# Altium schematic sheet TemperatureSensors.SchDoc: Temperaturas e termopares
size 420 x 297 mm; Author: Matheus Markies; DrawnBy: Matheus Markies; Engineer: Matheus Markies; DocumentNumber: ECTU-SCH-12; Revision: A definir; SheetNumber: 12; SheetTotal: 12; ProjectTitle: ROUTE ECU / ECTU; DocumentStatus: Em desenvolvimento; DocumentDate: 14/10/2026
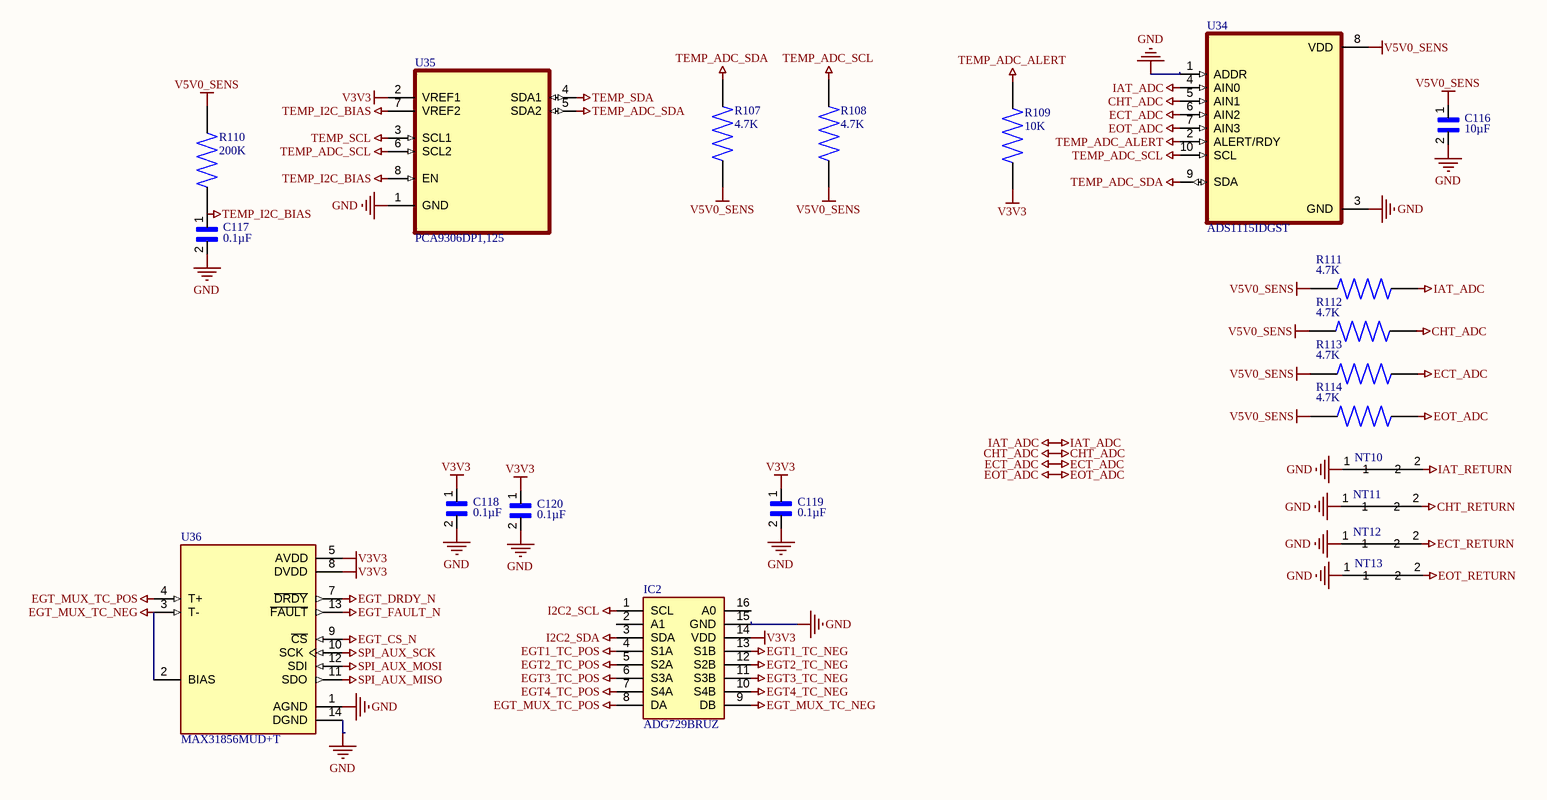
[diagram p0: TemperatureSensors.SchDoc]

## Parts
C116  10µF  [CAPC1608X90N]
C117  0.1µF  [CAPC1608X90N]
C118  0.1µF  [CAPC1608X90N]
C119  0.1µF  [CAPC1608X90N]
C120  0.1µF  [CAPC1608X90N]
IC2  ADG729BRUZ  [SOP65P640X120-16N]
NT10  (no value)  [NetTie]  (net tie, no BOM)
NT11  (no value)  [NetTie]  (net tie, no BOM)
NT12  (no value)  [NetTie]  (net tie, no BOM)
NT13  (no value)  [NetTie]  (net tie, no BOM)
R107  4.7K  [RESC3116X65N]
R108  4.7K  [RESC3116X65N]
R109  10K  [RESC3116X65N]
R110  200K  [RESC3116X65N]
R111  4.7K  [RESC3116X65N]
R112  4.7K  [RESC3116X65N]
R113  4.7K  [RESC3116X65N]
R114  4.7K  [RESC3116X65N]
U34  ADS1115IDGST  [SOP50P490X110-10N]
U35  PCA9306DP1,125  [SOP65P400X110-8N]
U36  MAX31856MUD+T  [SOP65P640X110-14N]

## Nets
CHT_ADC: R112.1 U34.5(AIN1)
CHT_RETURN: NT11.2
ECT_ADC: R113.1 U34.6(AIN2)
ECT_RETURN: NT12.2
EGT1_TC_NEG: IC2.13(S1B)
EGT1_TC_POS: IC2.4(S1A)
EGT2_TC_NEG: IC2.12(S2B)
EGT2_TC_POS: IC2.5(S2A)
EGT3_TC_NEG: IC2.11(S3B)
EGT3_TC_POS: IC2.6(S3A)
EGT4_TC_NEG: IC2.10(S4B)
EGT4_TC_POS: IC2.7(S4A)
EGT_CS_N: U36.9(~{CS})
EGT_DRDY_N: U36.7(~{DRDY})
EGT_FAULT_N: U36.13(~{FAULT})
EGT_MUX_TC_NEG: IC2.9(DB) U36.2(BIAS) U36.3(T-)
EGT_MUX_TC_POS: IC2.8(DA) U36.4(T+)
EOT_ADC: R114.1 U34.7(AIN3)
EOT_RETURN: NT13.2
GND: C116.2 C117.2 C118.2 C119.2 C120.2 IC2.15(GND) NT10.1 NT11.1 NT12.1 NT13.1 U34.1(ADDR) U34.3(GND) U35.1(GND) U36.1(AGND) U36.14(DGND)
I2C2_SCL: IC2.1(SCL)
I2C2_SDA: IC2.3(SDA)
IAT_ADC: R111.1 U34.4(AIN0)
IAT_RETURN: NT10.2
SPI_AUX_MISO: U36.11(SDO)
SPI_AUX_MOSI: U36.12(SDI)
SPI_AUX_SCK: U36.10(SCK)
TEMP_ADC_ALERT: R109.1 U34.2(ALERT/RDY)
TEMP_ADC_SCL: R108.1 U34.10(SCL) U35.6(SCL2)
TEMP_ADC_SDA: R107.1 U34.9(SDA) U35.5(SDA2)
TEMP_I2C_BIAS: C117.1 R110.2 U35.7(VREF2) U35.8(EN)
TEMP_SCL: U35.3(SCL1)
TEMP_SDA: U35.4(SDA1)
V3V3: C118.1 C119.1 C120.1 IC2.14(VDD) R109.2 U35.2(VREF1) U36.5(AVDD) U36.8(DVDD)
V5V0_SENS: C116.1 R107.2 R108.2 R110.1 R111.2 R112.2 R113.2 R114.2 U34.8(VDD)

Not connected (* = marked no-connect by the designer): IC2 2(A1) 16(A0)

## Notes on the sheet
- PROJETO
- STATUS
- FOLHA / SUBSISTEMA
- AUTOR
- CÓDIGO DO DESENHO
- ARQUIVO
- ATUALIZAÇÃO
- REVISÃO
- FOLHA
- FORMATO
- A3
- /

## Library data of the parts
C116-C120 = 06035C104MAZ2A: Multilayer Ceramic Capacitors MLCC - SMD/SMT; Package: None; Price: None; Value: *; MP: 06035C104MAZ2A; Availability: Unavailable
IC2 = ADG729BRUZ: Integrated Circuit; Manufacturer_Name: Analog Devices; Datasheet Link: https://componentsearchengine.com/Datasheets/2/ADG729BRUZ.pdf; Height: 1.2mm; Manufacturer_Part_Number: ADG729BRUZ; Mouser Part Number: 584-ADG729BRUZ; Mouser Price/Stock: https://www.mouser.co.uk/ProductDetail/Analog-Devices/ADG729BRUZ?qs=BpaRKvA4VqGOrPO6FEWg%252Bw%3D%3D; Arrow Part Number: ADG729BRUZ; Arrow Price/Stock: https://www.arrow.com/en/products/adg729bruz/analog-devices
NT10-NT13 = NT
R107-R110 = AA1206JR-07470RL: Package: None; Price: None; Value: *; MP: AA1206JR-07470RL; Availability: Unavailable
R111-R114 = RC1206FR-074K7L: 4.7 kOhms Â±1% 0.25W, 1/4W Chip Resistor 1206 (3216 Metric) Moisture Resistant Thick Film; MF: Yageo; SnapEDA_Link: https://www.snapeda.com/parts/RC1206FR-074K7L/Yageo/view-part/?ref=snap; Package: 3116 Yageo; Value: *; MP: RC1206FR-074K7L; Check_prices: https://www.snapeda.com/parts/RC1206FR-074K7L/Yageo/view-part/?ref=eda
U34 = ADS1115IDGST: 16-bit, 860-SPS, 4-channel, delta-sigma ADC with PGA, oscillator, VREF, comparator and I2C; MF: Texas Instruments; SnapEDA_Link: https://www.snapeda.com/parts/ADS1115IDGST/Texas+Instruments/view-part/?ref=snap; Package: VSSOP-10 Texas Instruments; Value: *; MP: ADS1115IDGST; Check_prices: https://www.snapeda.com/parts/ADS1115IDGST/Texas+Instruments/view-part/?ref=eda
U35 = PCA9306DP1,125: Voltage Level Translator Bidirectional 1 Circuit 2 Channel - 8-TSSOP; MF: NXP USA; SnapEDA_Link: https://www.snapeda.com/parts/PCA9306DP1,125/NXP+Semiconductors/view-part/?ref=snap; Package: TSSOP-8 NXP Semiconductors; Value: *; MP: PCA9306DP1,125; Check_prices: https://www.snapeda.com/parts/PCA9306DP1,125/NXP+Semiconductors/view-part/?ref=eda
U36 = MAX31856MUD+T: Precision Thermocouple to Digital Converter with Linearization; MF: Analog Devices; SnapEDA_Link: https://www.snapeda.com/parts/MAX31856MUD+T/Analog+Devices/view-part/?ref=snap; Package: TSSOP-14 Maxim; Value: *; MP: MAX31856MUD+T; Check_prices: https://www.snapeda.com/parts/MAX31856MUD+T/Analog+Devices/view-part/?ref=eda